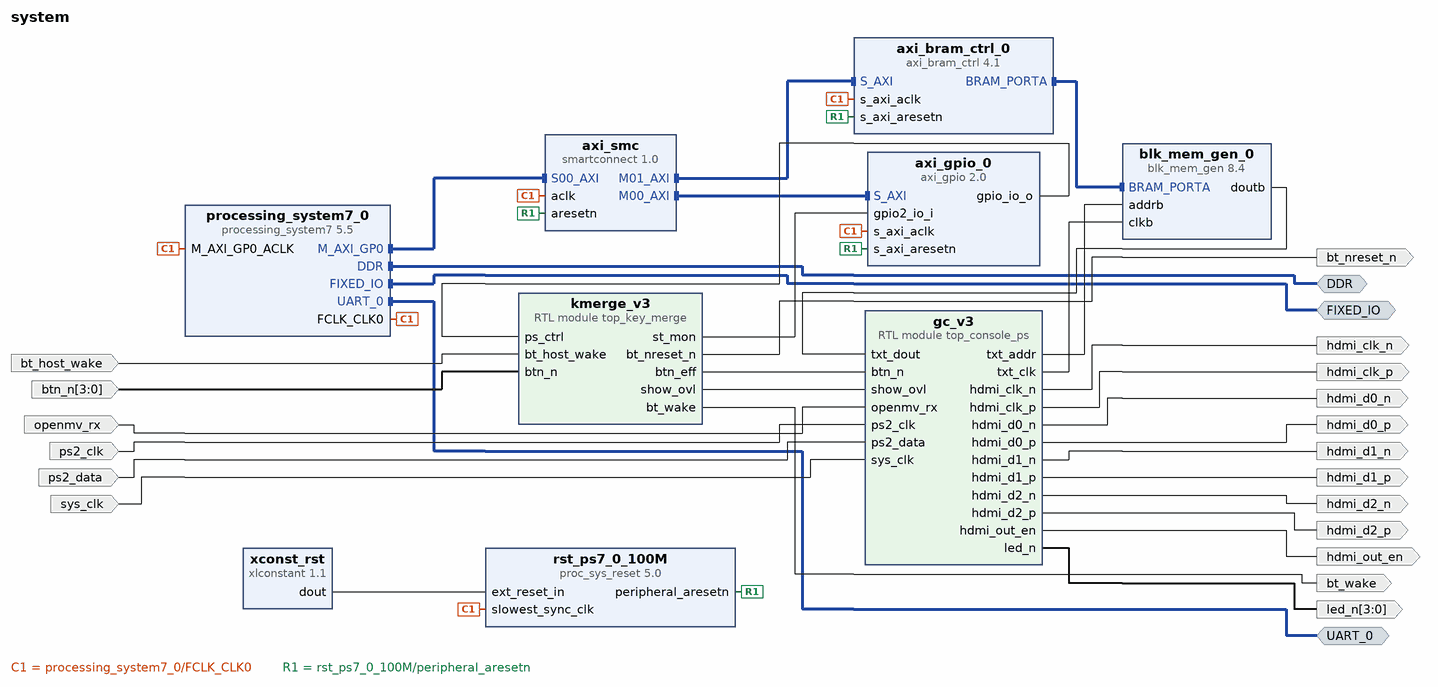
[diagram p0: block diagram of the top level]
# Vivado block design system, xc7z020clg400-2, Vivado 2026.1
create_bd_design system

create_bd_intf_port -mode Master -vlnv xilinx.com:interface:uart_rtl:1.0 UART_0
create_bd_intf_port -mode Master -vlnv xilinx.com:interface:ddrx_rtl:1.0 DDR
create_bd_intf_port -mode Master -vlnv xilinx.com:display_processing_system7:fixedio_rtl:1.0 FIXED_IO
create_bd_port -dir I -type clk sys_clk
set_property -dict {CONFIG.FREQ_HZ 50000000} [get_bd_ports sys_clk]
create_bd_port -dir I -from 3 -to 0 btn_n
create_bd_port -dir O -from 3 -to 0 led_n
create_bd_port -dir O hdmi_out_en
create_bd_port -dir O hdmi_clk_p
create_bd_port -dir O hdmi_clk_n
create_bd_port -dir O hdmi_d0_p
create_bd_port -dir O hdmi_d0_n
create_bd_port -dir O hdmi_d1_p
create_bd_port -dir O hdmi_d1_n
create_bd_port -dir O hdmi_d2_p
create_bd_port -dir O hdmi_d2_n
create_bd_port -dir O bt_nreset_n
create_bd_port -dir O bt_wake
create_bd_port -dir I bt_host_wake
create_bd_port -dir I ps2_clk
create_bd_port -dir I ps2_data
create_bd_port -dir I openmv_rx

create_bd_cell -type ip -vlnv xilinx.com:ip:processing_system7:5.5 processing_system7_0
set_property -dict [list \
  CONFIG.PCW_EN_RST0_PORT 0 \
  CONFIG.PCW_FCLK_CLK0_BUF FALSE \
  CONFIG.PCW_FPGA0_PERIPHERAL_FREQMHZ 100 \
  CONFIG.PCW_GPIO_MIO_GPIO_ENABLE 1 \
  CONFIG.PCW_GPIO_MIO_GPIO_IO MIO \
  CONFIG.PCW_I2C_RESET_ENABLE 1 \
  CONFIG.PCW_QSPI_GRP_SINGLE_SS_ENABLE 1 \
  CONFIG.PCW_QSPI_GRP_SINGLE_SS_IO {MIO 1 .. 6} \
  CONFIG.PCW_QSPI_PERIPHERAL_ENABLE 1 \
  CONFIG.PCW_QSPI_QSPI_IO {MIO 1 .. 6} \
  CONFIG.PCW_SD0_GRP_CD_ENABLE 0 \
  CONFIG.PCW_SD0_GRP_WP_ENABLE 0 \
  CONFIG.PCW_SD0_PERIPHERAL_ENABLE 1 \
  CONFIG.PCW_SD0_SD0_IO {MIO 40 .. 45} \
  CONFIG.PCW_SDIO_PERIPHERAL_FREQMHZ 100 \
  CONFIG.PCW_SINGLE_QSPI_DATA_MODE x4 \
  CONFIG.PCW_UART0_PERIPHERAL_ENABLE 1 \
  CONFIG.PCW_UART0_UART0_IO EMIO \
  CONFIG.PCW_UART1_PERIPHERAL_ENABLE 1 \
  CONFIG.PCW_UART1_UART1_IO {MIO 48 .. 49} \
  CONFIG.PCW_UART_PERIPHERAL_FREQMHZ 100 \
  CONFIG.PCW_UIPARAM_DDR_FREQ_MHZ 533.333333 \
  CONFIG.PCW_UIPARAM_DDR_PARTNO {MT41J256M16 RE-125} \
  CONFIG.PCW_USB0_PERIPHERAL_ENABLE 1 \
  CONFIG.PCW_USB0_RESET_ENABLE 0 \
  CONFIG.PCW_USB0_USB0_IO {MIO 28 .. 39} \
  CONFIG.PCW_USB_RESET_ENABLE 1 \
  CONFIG.PCW_USB_RESET_SELECT {Share reset pin} \
] [get_bd_cells processing_system7_0]
# 208 more settings of processing_system7_0 are not shown: defaults, MIO pin electricals, DDR timing, and values the tool derives
create_bd_cell -type ip -vlnv xilinx.com:ip:axi_gpio:2.0 axi_gpio_0
set_property -dict [list \
  CONFIG.C_ALL_INPUTS_2 1 \
  CONFIG.C_ALL_OUTPUTS 1 \
  CONFIG.C_GPIO2_WIDTH 5 \
  CONFIG.C_GPIO_WIDTH 32 \
  CONFIG.C_IS_DUAL 1 \
] [get_bd_cells axi_gpio_0]
create_bd_cell -type ip -vlnv xilinx.com:ip:smartconnect:1.0 axi_smc
set_property -dict {CONFIG.NUM_MI 3 CONFIG.NUM_SI 1} [get_bd_cells axi_smc]
create_bd_cell -type ip -vlnv xilinx.com:ip:proc_sys_reset:5.0 rst_ps7_0_100M
set_property -dict {CONFIG.C_AUX_RESET_HIGH 0} [get_bd_cells rst_ps7_0_100M]
create_bd_cell -type ip -vlnv xilinx.com:ip:axi_bram_ctrl:4.1 axi_bram_ctrl_0
set_property -dict {CONFIG.DATA_WIDTH 32 CONFIG.PROTOCOL AXI4 CONFIG.SINGLE_PORT_BRAM 1} [get_bd_cells axi_bram_ctrl_0]
create_bd_cell -type ip -vlnv xilinx.com:ip:blk_mem_gen:8.4 blk_mem_gen_0
set_property -dict [list \
  CONFIG.Enable_A Use_ENA_Pin \
  CONFIG.Enable_B Always_Enabled \
  CONFIG.Memory_Type True_Dual_Port_RAM \
  CONFIG.Operating_Mode_A WRITE_FIRST \
  CONFIG.Operating_Mode_B WRITE_FIRST \
  CONFIG.Read_Width_A 32 \
  CONFIG.Read_Width_B 32 \
  CONFIG.Register_PortA_Output_of_Memory_Core false \
  CONFIG.Register_PortA_Output_of_Memory_Primitives true \
  CONFIG.Register_PortB_Output_of_Memory_Core false \
  CONFIG.Register_PortB_Output_of_Memory_Primitives true \
  CONFIG.Write_Depth_A 1024 \
  CONFIG.Write_Width_A 32 \
  CONFIG.Write_Width_B 32 \
  CONFIG.use_bram_block Stand_Alone \
] [get_bd_cells blk_mem_gen_0]
create_bd_cell -type module -reference top_key_merge kmerge_v3
create_bd_cell -type module -reference top_console_ps gc_v3
create_bd_cell -type ip -vlnv xilinx.com:ip:xlconstant:1.1 xconst_rst
set_property -dict {CONFIG.CONST_VAL 1 CONFIG.CONST_WIDTH 1} [get_bd_cells xconst_rst]

# ---- connections ----

connect_bd_intf_net [get_bd_intf_pins axi_bram_ctrl_0/BRAM_PORTA] [get_bd_intf_pins blk_mem_gen_0/BRAM_PORTA]
connect_bd_intf_net [get_bd_intf_pins axi_smc/M00_AXI] [get_bd_intf_pins axi_gpio_0/S_AXI]
connect_bd_intf_net [get_bd_intf_pins axi_smc/M01_AXI] [get_bd_intf_pins axi_bram_ctrl_0/S_AXI]
connect_bd_intf_net [get_bd_intf_ports DDR] [get_bd_intf_pins processing_system7_0/DDR]
connect_bd_intf_net [get_bd_intf_ports FIXED_IO] [get_bd_intf_pins processing_system7_0/FIXED_IO]
connect_bd_intf_net [get_bd_intf_pins processing_system7_0/M_AXI_GP0] [get_bd_intf_pins axi_smc/S00_AXI]
connect_bd_intf_net [get_bd_intf_ports UART_0] [get_bd_intf_pins processing_system7_0/UART_0]
connect_bd_net [get_bd_pins axi_gpio_0/gpio_io_o] [get_bd_pins kmerge_v3/ps_ctrl]
connect_bd_net [get_bd_pins blk_mem_gen_0/doutb] [get_bd_pins gc_v3/txt_dout]
connect_bd_net [get_bd_ports bt_host_wake] [get_bd_pins kmerge_v3/bt_host_wake]
connect_bd_net [get_bd_ports btn_n] [get_bd_pins kmerge_v3/btn_n]
connect_bd_net -net gc_0_hdmi_clk_n [get_bd_pins gc_v3/hdmi_clk_n] [get_bd_ports hdmi_clk_n]
connect_bd_net -net gc_0_hdmi_clk_p [get_bd_pins gc_v3/hdmi_clk_p] [get_bd_ports hdmi_clk_p]
connect_bd_net -net gc_0_hdmi_d0_n [get_bd_pins gc_v3/hdmi_d0_n] [get_bd_ports hdmi_d0_n]
connect_bd_net -net gc_0_hdmi_d0_p [get_bd_pins gc_v3/hdmi_d0_p] [get_bd_ports hdmi_d0_p]
connect_bd_net -net gc_0_hdmi_d1_n [get_bd_pins gc_v3/hdmi_d1_n] [get_bd_ports hdmi_d1_n]
connect_bd_net -net gc_0_hdmi_d1_p [get_bd_pins gc_v3/hdmi_d1_p] [get_bd_ports hdmi_d1_p]
connect_bd_net -net gc_0_hdmi_d2_n [get_bd_pins gc_v3/hdmi_d2_n] [get_bd_ports hdmi_d2_n]
connect_bd_net -net gc_0_hdmi_d2_p [get_bd_pins gc_v3/hdmi_d2_p] [get_bd_ports hdmi_d2_p]
connect_bd_net -net gc_0_hdmi_out_en [get_bd_pins gc_v3/hdmi_out_en] [get_bd_ports hdmi_out_en]
connect_bd_net -net gc_0_led_n [get_bd_pins gc_v3/led_n] [get_bd_ports led_n]
connect_bd_net [get_bd_pins gc_v3/txt_addr] [get_bd_pins blk_mem_gen_0/addrb]
connect_bd_net [get_bd_pins gc_v3/txt_clk] [get_bd_pins blk_mem_gen_0/clkb]
connect_bd_net -net kmerge_0_bt_nreset_n [get_bd_pins kmerge_v3/bt_nreset_n] [get_bd_ports bt_nreset_n]
connect_bd_net -net kmerge_0_bt_wake [get_bd_pins kmerge_v3/bt_wake] [get_bd_ports bt_wake]
connect_bd_net [get_bd_pins kmerge_v3/btn_eff] [get_bd_pins gc_v3/btn_n]
connect_bd_net [get_bd_pins kmerge_v3/show_ovl] [get_bd_pins gc_v3/show_ovl]
connect_bd_net [get_bd_pins kmerge_v3/st_mon] [get_bd_pins axi_gpio_0/gpio2_io_i]
connect_bd_net [get_bd_ports openmv_rx] [get_bd_pins gc_v3/openmv_rx]
connect_bd_net [get_bd_pins processing_system7_0/FCLK_CLK0] \
  [get_bd_pins processing_system7_0/M_AXI_GP0_ACLK] [get_bd_pins axi_smc/aclk] [get_bd_pins axi_gpio_0/s_axi_aclk] \
  [get_bd_pins rst_ps7_0_100M/slowest_sync_clk] [get_bd_pins axi_bram_ctrl_0/s_axi_aclk]
connect_bd_net [get_bd_ports ps2_clk] [get_bd_pins gc_v3/ps2_clk]
connect_bd_net [get_bd_ports ps2_data] [get_bd_pins gc_v3/ps2_data]
connect_bd_net [get_bd_pins rst_ps7_0_100M/peripheral_aresetn] \
  [get_bd_pins axi_gpio_0/s_axi_aresetn] [get_bd_pins axi_smc/aresetn] [get_bd_pins axi_bram_ctrl_0/s_axi_aresetn]
connect_bd_net [get_bd_ports sys_clk] [get_bd_pins gc_v3/sys_clk]
connect_bd_net [get_bd_pins xconst_rst/dout] [get_bd_pins rst_ps7_0_100M/ext_reset_in]
set_property HDL_ATTRIBUTE.BMM_INFO_PROCESSOR {arm > system axi_bram_ctrl_0} [get_bd_cells processing_system7_0]
set_property HDL_ATTRIBUTE.KEEP_HIERARCHY yes [get_bd_cells processing_system7_0]
set_property HDL_ATTRIBUTE.BMM_INFO_ADDRESS_SPACE {byte  0x42000000 32 > system blk_mem_gen_0} [get_bd_cells axi_bram_ctrl_0]
set_property HDL_ATTRIBUTE.KEEP_HIERARCHY yes [get_bd_cells axi_bram_ctrl_0]

# ---- address map ----
assign_bd_address -offset 0x41200000 -range 64K -target_address_space [get_bd_addr_spaces processing_system7_0/Data] [get_bd_addr_segs axi_gpio_0/S_AXI/Reg]
assign_bd_address -offset 0x42000000 -range 4K -target_address_space [get_bd_addr_spaces processing_system7_0/Data] [get_bd_addr_segs axi_bram_ctrl_0/S_AXI/Mem0]

validate_bd_design
save_bd_design
